# EasyEDA Pro project P3+KG.epro, board PCB2
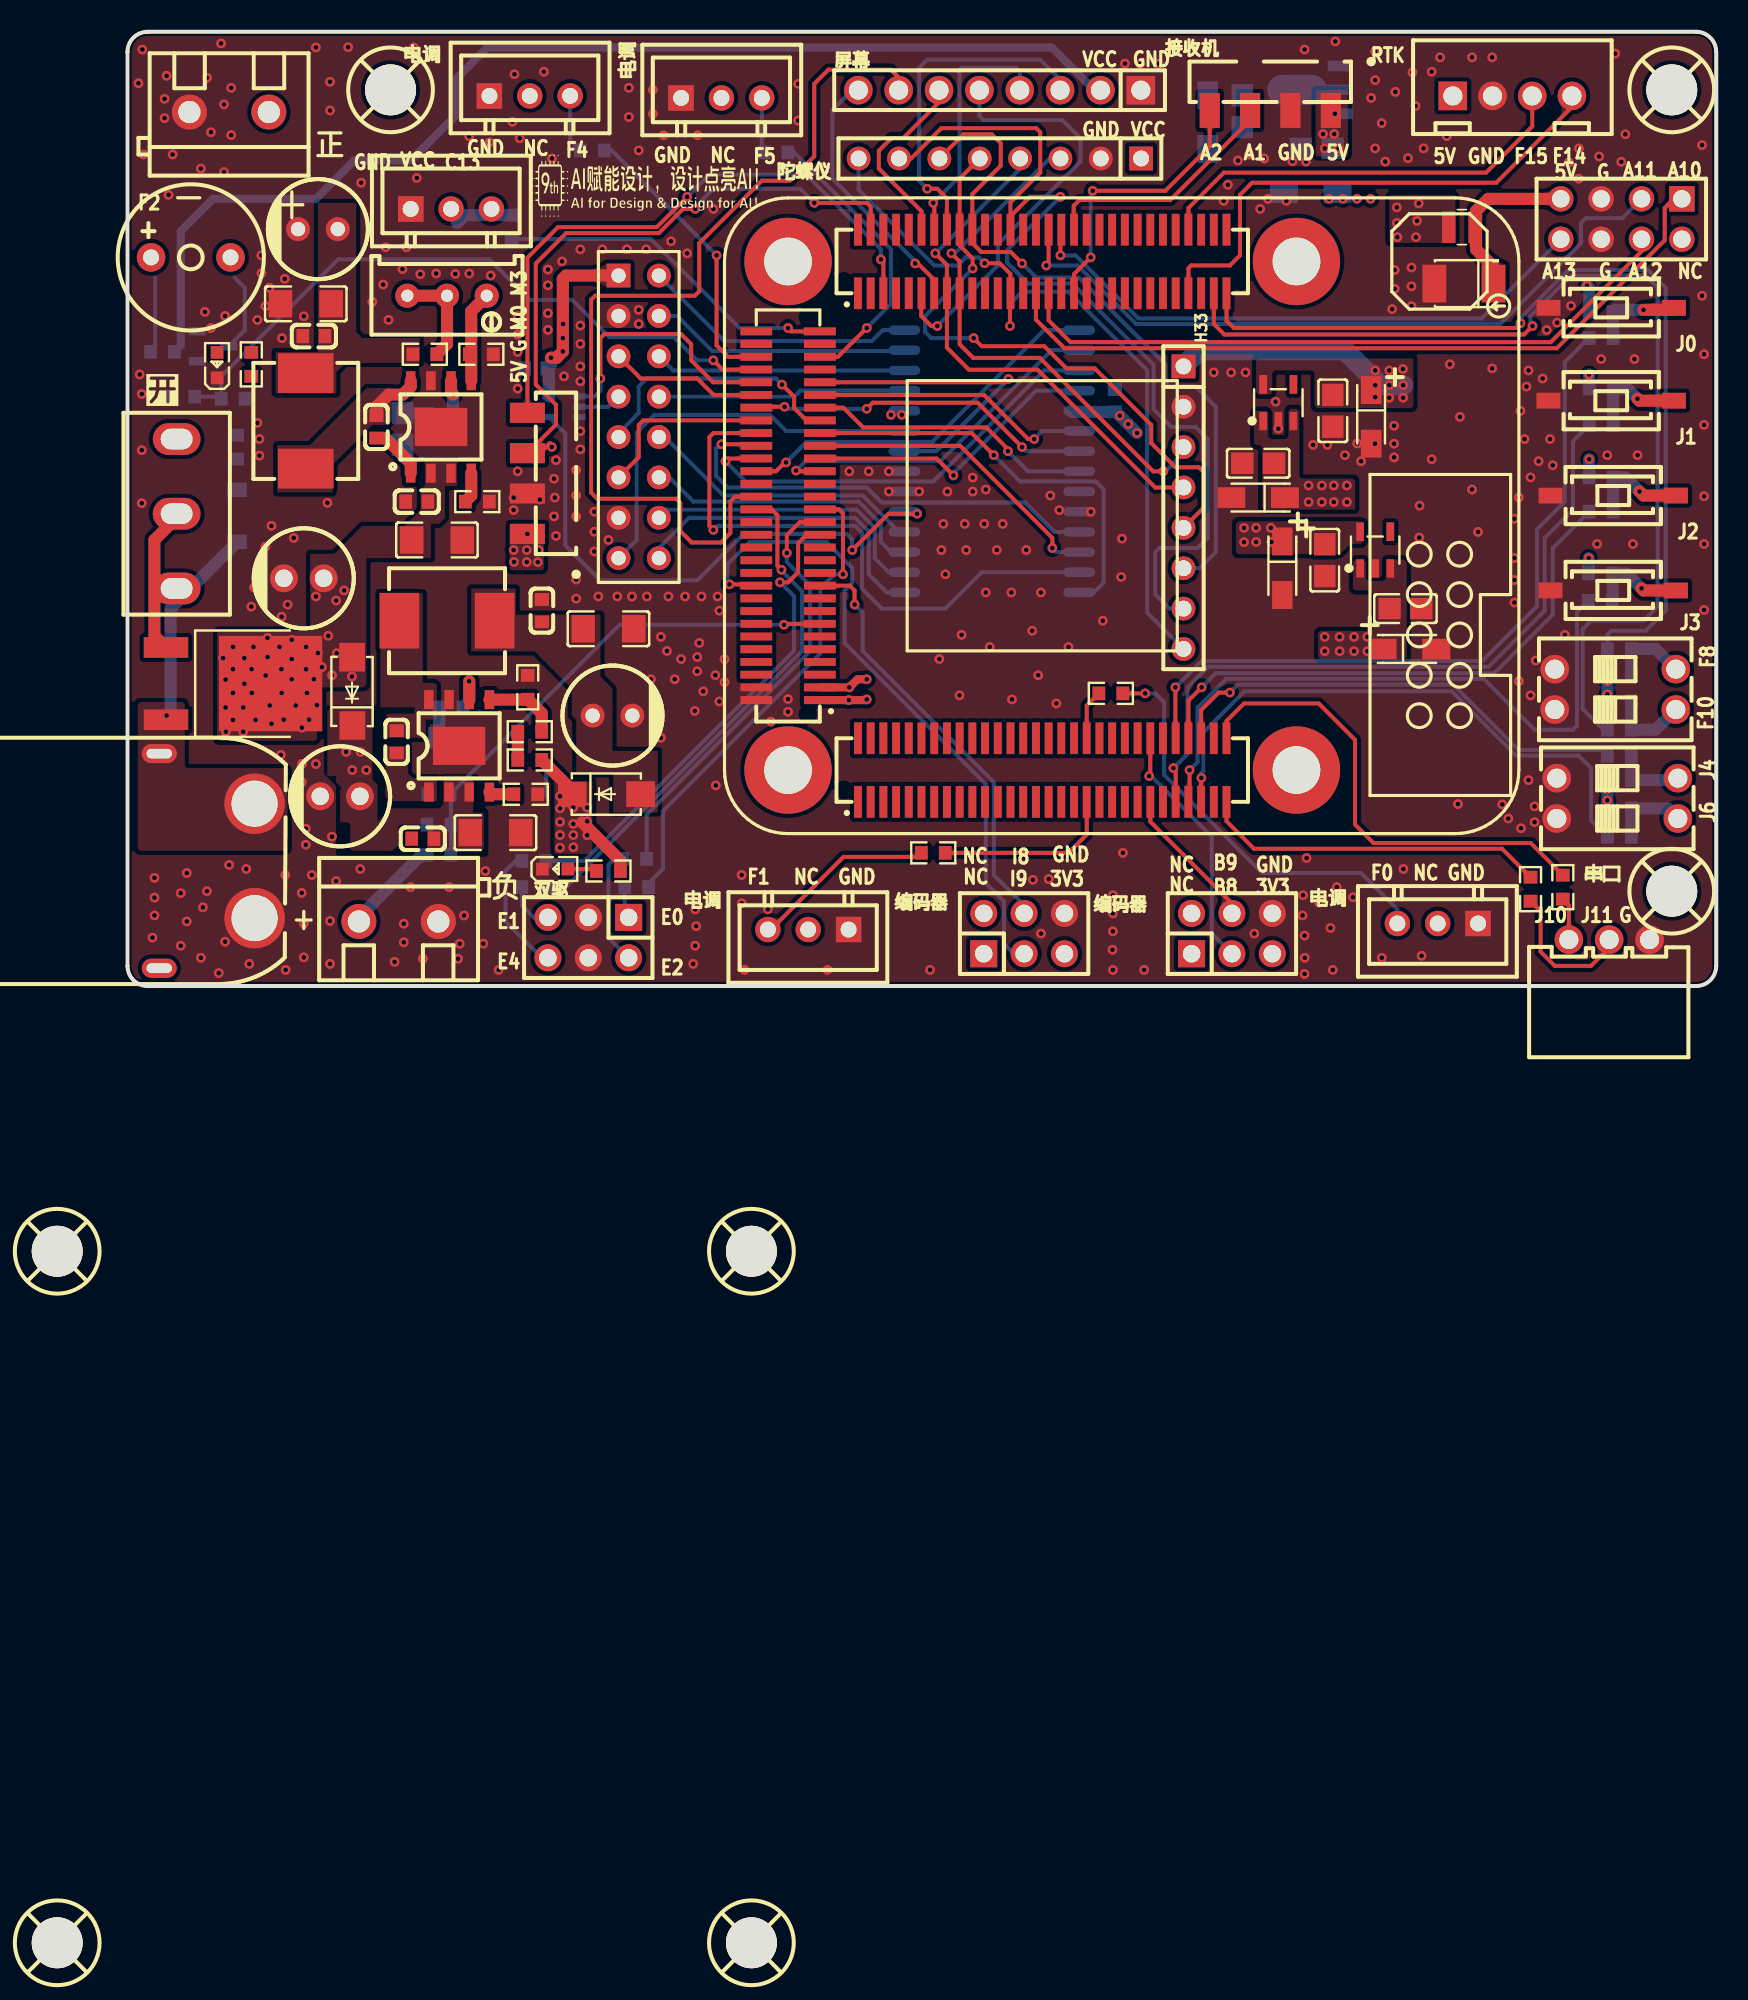
[diagram p9: board, top side]
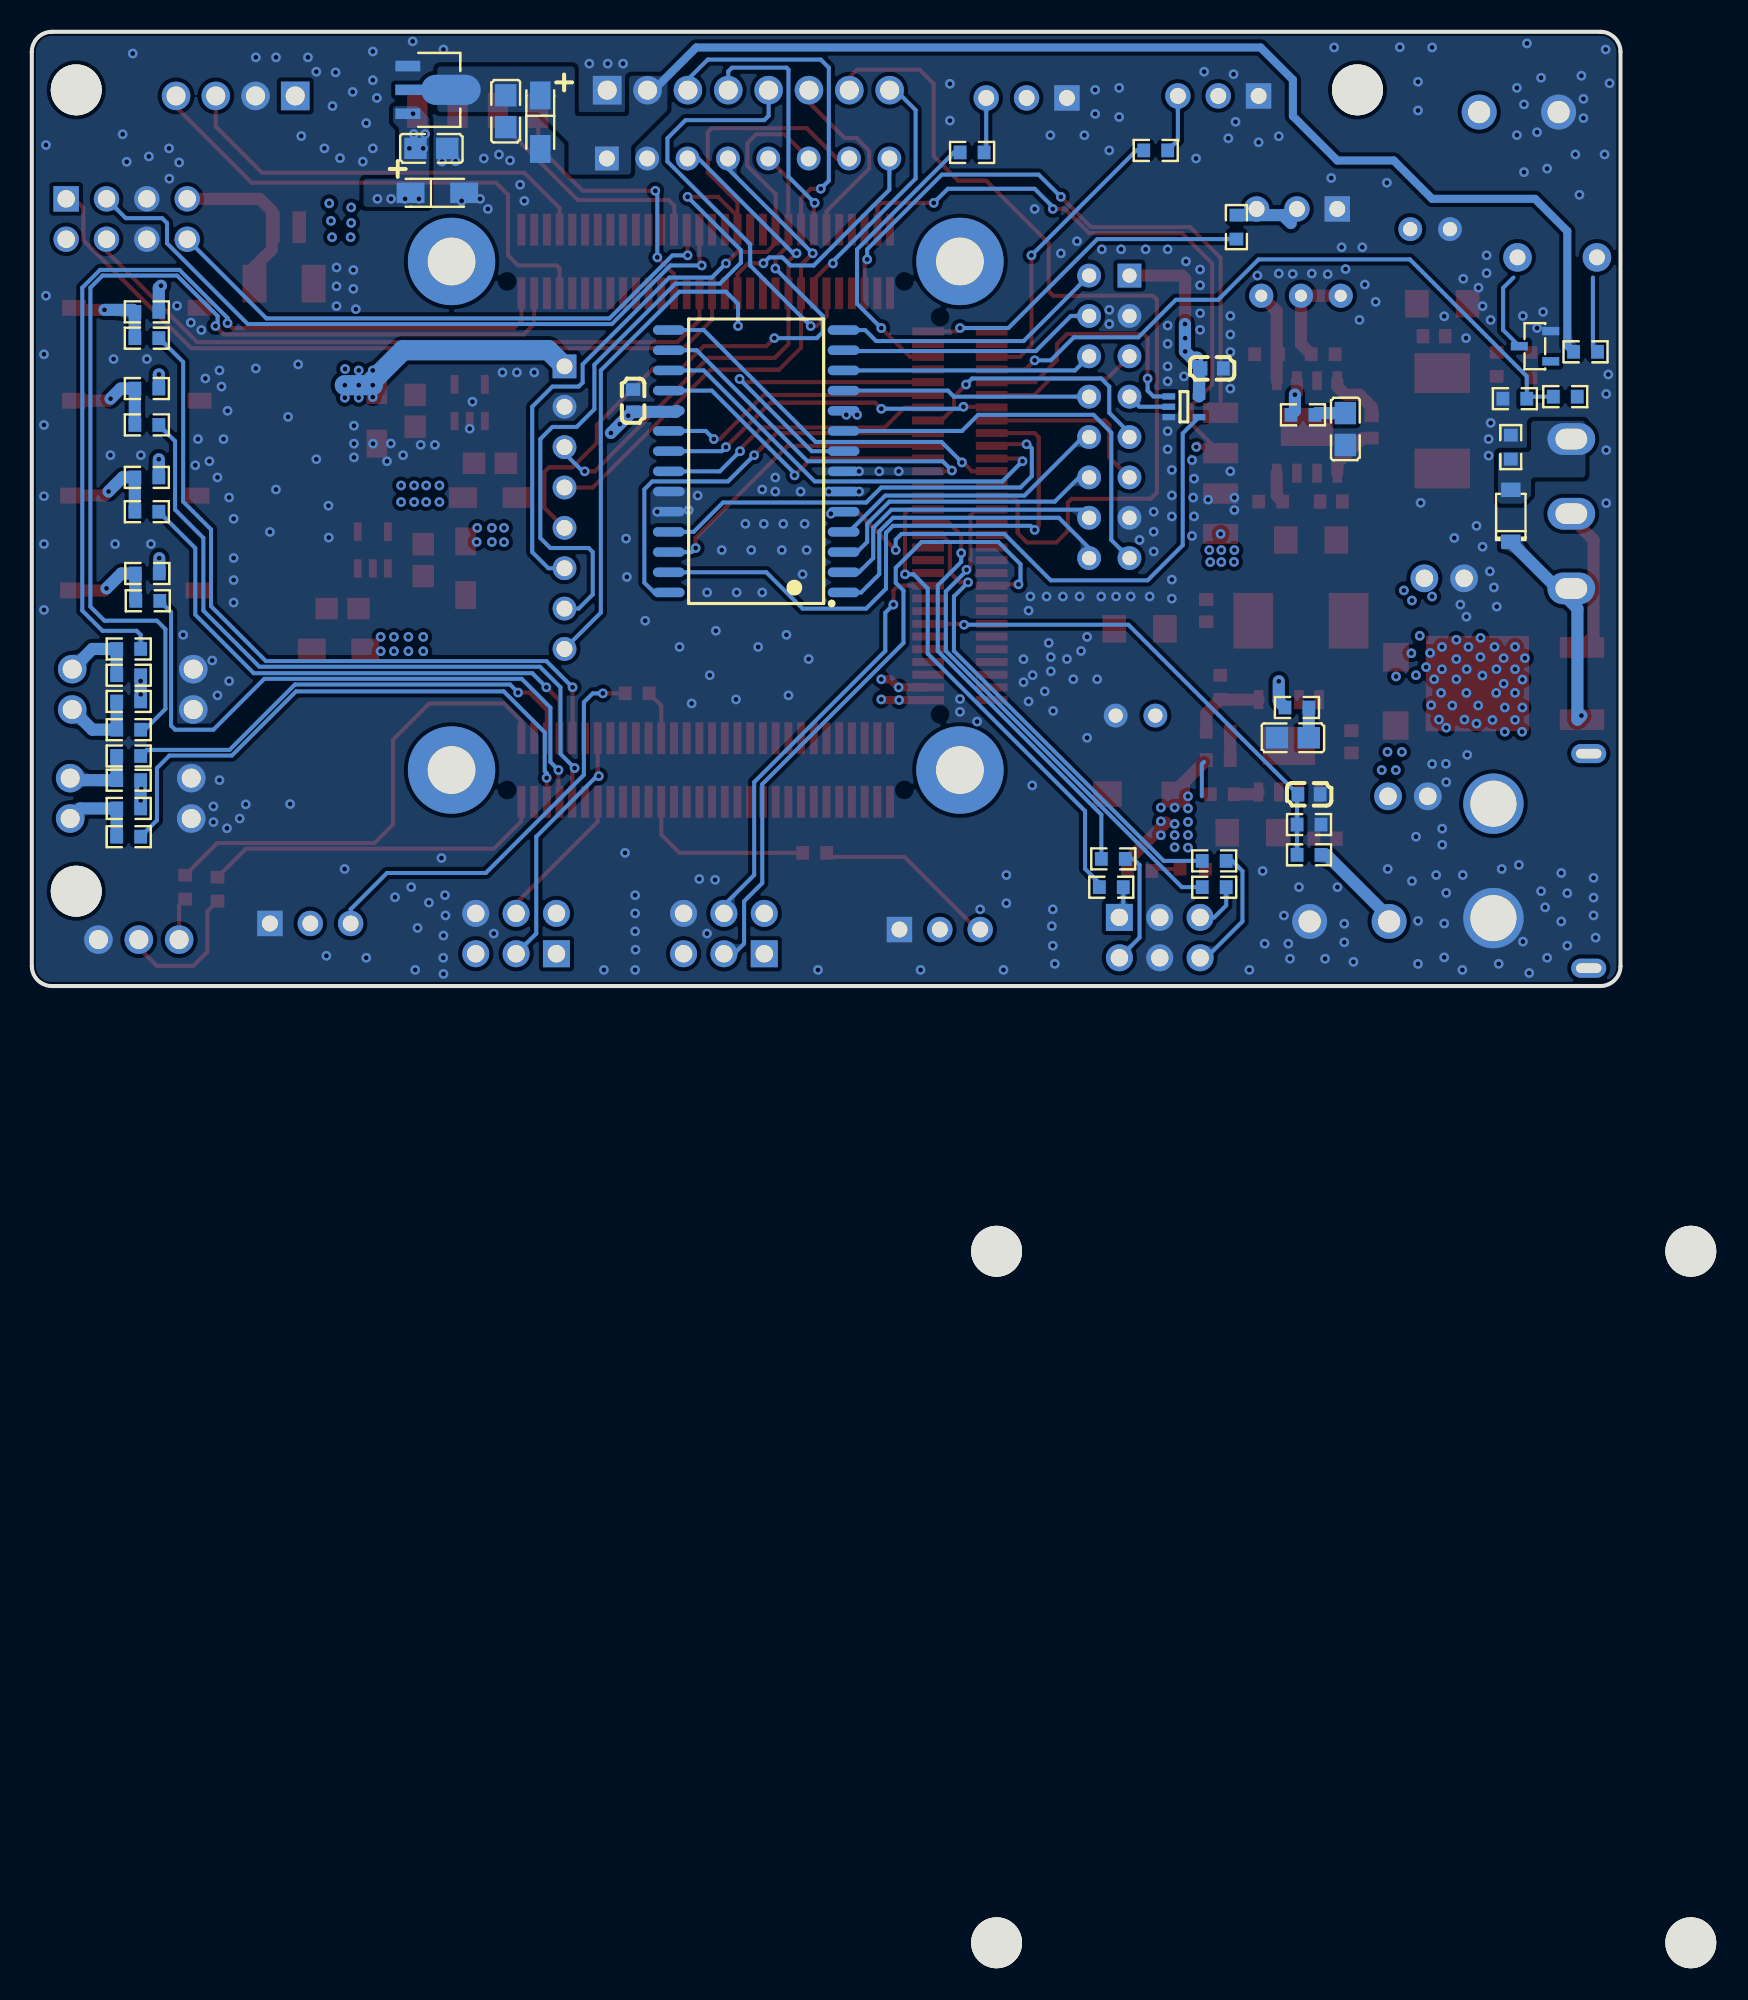
[diagram p10: board, bottom side, seen from below]

Outline 100 x 60.04 mm; copper layers: Top Layer, GND, VCC, Bottom Layer. Coordinates in mm from the lower left corner of the outline.
Outline path: 0,58.77 0,1.27 arc(0.37,0.37) 1.27,0 98.73,0 arc(99.63,0.37) 100,1.27 100,58.77 arc(99.63,59.67) 98.73,60.04 1.27,60.04 arc(0.37,59.67) 0,58.77
Stack: Top Layer 0.035mm 外层铜厚1oz / Dielectric1 0.2104mm 7628 RC49% 8.6mil / GND 0.0152mm 内层铜厚 / Dielectric2 1.065mm 1.1mm H/HOZ Copper / VCC 0.0152mm 内层铜厚 / Dielectric3 0.2104mm 7628 RC49% 8.6mil / Bottom Layer 0.035mm 外层铜厚1oz

## Design rules (mm)
template: 自定义配置
spacing copperThickness1oz (default): track to track 0.102, other pairs 0.152 to 0.3
spacing copperThickness2oz: track to track 0.203, other pairs 0.152 to 0.3
track width copperThickness1oz (default): min 0.127, default 0.254, max 2.54
track width copperThickness2oz: min 0.203, default 0.254, max 2.54
differential pair differentialPair (default): width min 0.127, default 0.254, max 2.54; gap min 0.152, default 0.152
via viaSize (default): diameter min 0.5, default 0.61, max 10; hole min 0.3, default 0.305, max 6.3

## Placement (name value [footprint] x y rotation side)
1  RT9013-33GB  [SOT-23-5_L3.0-W1.7-P0.95-LS2.8-BL]  78.53 27.43 0 top
BUZZER2  3kHz  [BUZ-TH_BD9.0-P5.00-D0.6-FD]  3.98 45.85 0 top
C1  100uF  [CAP-TH_BD6.3-P2.50-D0.6-FD]  11.1 25.65 180 top
C2  4.7uF  [C1206]  19.48 28.07 180 top
C3  100nF  [C0603]  18.21 30.48 0 top
C4  100nF  [C0603]  15.67 35.18 90 top
C5  47uF  [C1206]  11.22 42.93 0 top
C6  220uF  [CAP-TH_BD6.3-P2.50-D0.5-FD]  11.99 47.62 180 top
C7  100nF  [C0603]  11.73 40.89 0 top
C8  4.7nF  [C0805]  17.32 35.05 270 bottom
C9  100uF  [CAP-TH_BD6.3-P2.50-D0.6-FD]  13.38 11.94 180 top
C10  4.7uF  [C1206]  23.16 9.65 180 top
C11  100nF  [C0603]  18.59 9.27 0 top
C12  100nF  [C0603]  16.94 15.37 90 top
C13  47uF  [C1206]  30.27 22.48 180 top
C14  220uF  [CAP-TH_BD6.3-P2.50-D0.5-FD]  30.53 17.02 0 top
C15  100nF  [C0603]  26.08 23.62 270 top
C16  4.7nF  [C0805]  20.62 15.62 0 bottom
C18  10uF  [CAP-SMD_L3.2-W1.6-RD-C7171]  67.99 54.36 270 bottom
C19  100nF  [C0805]  70.17 55.04 90 bottom
C20  100nF  [C0805]  74.85 52.7 0 bottom
C21  10uF  [CAP-SMD_L3.2-W1.6-RD-C7171]  74.47 49.91 180 bottom
C42  10uF  [CAP-SMD_L3.2-W1.6-RD-C7171]  71.17 30.73 180 top
C43  100nF  [C0805]  71.17 32.89 0 top
C44  100nF  [C0805]  75.87 36.19 90 top
C45  10uF  [CAP-SMD_L3.2-W1.6-RD-C7171]  78.28 35.81 270 top
C80  10uF  [CAP-SMD_L3.2-W1.6-RD-C7171]  72.69 26.29 270 top
C81  10uF  [CAP-SMD_L3.2-W1.6-RD-C7171]  80.69 21.21 0 top
C82  100nF  [C0805]  80.44 23.75 180 top
C83  100nF  [C0805]  75.36 26.8 90 top
C85  100nF  [C0603]  19.61 12.06 0 bottom
C258  47uF  [CASE-B_3528]  84.12 44.2 180 top
C259  100nF  [C0603]  25.7 38.86 0 bottom
C260  100nF  [C0603]  62.15 36.83 270 bottom
CN1  ZX-XH2.54-3PZZ  [CONN-TH_3P-P2.54_2501S-3P]  42.85 3.56 180 top
CN2  ZX-XH2.54-3PZZ  [CONN-TH_3P-P2.54_2501S-3P]  82.47 3.94 180 top
CN3  ZX-XH2.54-3PZZ  [CONN-TH_3P-P2.54_2501S-3P]  25.32 56.01 0 top
CN4  ZX-XH2.54-3PZZ  [CONN-TH_3P-P2.54_2501S-3P]  37.39 55.88 0 top
CN5  ZX-XH2.54-3PZZ  [CONN-TH_3P-P2.54_2501S-3P]  20.37 48.89 0 top
CN6  AXH-4A-11  [CONN-TH_KH-XH-4A-Z]  87.17 56.01 0 top
CN7  XT60PW-M  [CONN-TH_XT60PW-M]  5 7.87 0 top
CN9  XH-3AW  [CONN-TH_3P-P2.54_HCTL_XH-3AW]  93.27 2.92 180 top
D6  BZT52C16  [SOD-123_L2.7-W1.6-LS3.7-RD]  6.91 29.59 90 bottom
D7  SS54  [SMA_L4.3-W2.6-LS5.0-FD]  14.14 18.54 270 top
D8  SS54  [SMA_L4.3-W2.6-LS5.0-FD]  30.15 12.06 180 top
H27  PZ254V-11-08P  [HDR-TH_8P-P2.54-V-M]  54.91 52.07 180 top
H29  PZ254V-12-6P  [HDR-TH_6P-P2.54-V-M-R2-C3-S2.54]  29 3.05 180 top
H30  PM254V-12-08-H85  [HDR-TH_8P-P2.54-V-F-R2-C4-S2.54]  94.03 48.26 180 top
H31  PZ254V-12-6P  [HDR-TH_6P-P2.54-V-M-R2-C3-S2.54]  69.52 3.3 0 top
H32  PZ254V-12-6P  [HDR-TH_6P-P2.54-V-M-R2-C3-S2.54]  56.44 3.3 0 top
H33  PZ254V-11-08P  [HDR-TH_8P-P2.54-V-M]  66.47 30.1 270 top
L1  4.7uH  [IND-SMD_L7.3-W6.6_YSPI07XX]  11.22 35.56 90 top
L2  4.7uH  [IND-SMD_L7.3-W6.6_YSPI07XX]  20.11 22.99 0 top
LED1  -  [LED_0603]  5.64 39.12 90 top
LED2  -  [LED_0603]  26.97 7.37 0 top
P16  Camera Interface  [Cam_HDR2X8]  30.91 44.7 270 top
Q1  HY19P03D  [TO-252-2_L6.6-W6.1-P4.57-LS9.9-TL-CW]  5.72 19.03 0 top
Q2  S8050  [SOT-23-3_L2.9-W1.3-P1.90-LS2.3-BR]  5.38 40.26 180 bottom
Q13  AMS1117-3.3V  [SOT-89-3_L4.5-W2.5-P1.50-LS4.2-BR]  74.98 56.39 0 bottom
R1  200kΩ  [R0603]  22.02 30.48 180 top
R2  20kΩ  [R0603]  19.99 35.94 180 bottom
R3  27kΩ  [R0603]  18.72 39.75 180 top
R4  50kΩ  [RES-ADJ-TH_3P-L9.5-W4.85-P2.50-BL-BS]  20.11 43.43 270 top
R5  8.2kΩ  [R0603]  22.27 39.75 180 top
R6  10kΩ  [R0603]  7.79 39.12 270 top
R7  200kΩ  [R0603]  25.07 12.06 180 top
R8  20kΩ  [R0603]  20.37 17.53 180 bottom
R12  10kΩ  [R0603]  30.27 7.24 0 top
R13  51kΩ  [R0603]  25.32 14.22 0 top
R14  1.5kΩ  [R0603]  25.32 16 180 top
R15  10kΩ  [R0603]  25.19 18.8 270 top
R20  100Ω  [R0603]  25.57 6.22 180 bottom
R21  100Ω  [R0603]  32.05 6.22 0 bottom
R22  100Ω  [R0603]  25.57 7.87 180 bottom
R23  100Ω  [R0603]  31.92 8 0 bottom
R24  100Ω  [R0603]  50.72 8.38 0 top
R25  100Ω  [R0603]  61.9 18.41 180 top
R26  100Ω  [R0603]  29.26 52.58 0 bottom
R27  100Ω  [R0603]  40.81 52.45 0 bottom
R28  100Ω  [R0603]  93.9 14.48 180 bottom
R29  100Ω  [R0603]  93.9 9.4 180 bottom
R30  100Ω  [R0603]  92.76 40.77 180 bottom
R31  100Ω  [R0603]  92.76 35.31 180 bottom
R32  100Ω  [R0603]  92.76 29.84 180 bottom
R33  100Ω  [R0603]  92.7 24.24 180 bottom
R34  4.7kΩ  [R0603]  93.9 12.95 0 bottom
R35  4.7kΩ  [R0603]  93.9 11.18 0 bottom
R36  4.7kΩ  [R0603]  92.76 42.42 0 bottom
R37  4.7kΩ  [R0603]  92.76 37.59 0 bottom
R38  4.7kΩ  [R0603]  92.76 32 0 bottom
R39  4.7kΩ  [R0603]  92.73 25.96 0 bottom
R40  10kΩ  [R0603]  19.61 8.25 0 bottom
R41  1kΩ  [R0603]  19.61 10.16 180 bottom
R42  10kΩ  [R0603]  6.91 33.91 270 bottom
R43  100Ω  [R0603]  24.18 47.75 90 bottom
R44  10Ω  [R0603]  2.2 39.91 180 bottom
R45  4.7kΩ  [R0603]  3.48 37.08 180 bottom
R46  10kΩ  [R0603]  6.65 36.96 0 bottom
R47  100Ω  [R0603]  93.9 21.21 180 bottom
R48  100Ω  [R0603]  93.9 16.13 180 bottom
R49  4.7kΩ  [R0603]  93.9 19.56 0 bottom
R50  4.7kΩ  [R0603]  93.9 17.91 0 bottom
R51  100Ω  [R0603]  90.34 6.22 90 top
R52  100Ω  [R0603]  88.31 6.1 90 top
SCREW1  -  [M3螺丝]  16.56 56.39 0 top
SCREW2  -  [M3螺丝]  97.2 5.97 0 top
SCREW3  -  [M3螺丝]  97.2 56.39 0 top
SCREW4  -  [M3螺丝]  -4.42 -60.2 0 top
SCREW5  -  [M3螺丝]  39.27 -60.2 0 top
SCREW6  -  [M3螺丝]  39.27 -16.69 0 top
SCREW7  -  [M3螺丝]  -4.42 -16.69 0 top
SW1  K2-1107ST-A1SW-06  [SW-SMD_L6.0-W3.6-LS8.0]  93.39 42.67 180 top
SW3  K2-1107ST-A1SW-06  [SW-SMD_L6.0-W3.6-LS8.0]  93.52 30.86 180 top
SW4  K2-1107ST-A1SW-06  [SW-SMD_L6.0-W3.6-LS8.0]  93.52 24.89 180 top
SW5  K2-1107ST-A1SW-06  [SW-SMD_L6.0-W3.6-LS8.0]  93.39 36.83 180 top
SW6  DSWB02LHGET  [SW-TH_DSWB02LHGET]  93.77 11.81 270 top
SW9  SS-12D10L5  [SW-TH_SS-12D10L5]  3.1 29.72 90 top
SW10  DSWB02LHGET  [SW-TH_DSWB02LHGET]  93.65 18.67 270 top
U1  -  [SR6P3C4_CoreBoard_Lite]  57.58 29.59 90 top
U2  SCT2450STER  [ESOP-8_L4.9-W3.9-P1.27-LS6.0-BL-EP]  19.73 35.18 0 top
U3  SCT2450STER  [ESOP-8_L4.9-W3.9-P1.27-LS6.0-BL-EP]  20.88 15.11 0 top
U10  RT9013-33GB  [SOT-23-5_L3.0-W1.7-P0.95-LS2.8-BL]  72.44 36.7 0 top
U20  -  [HDR-TH_8P-P2.54-V-F-1]  56.56 58.04 180 top
U21  SN74LVC1G00DCKR  [SOT-353]  27.48 36.45 180 bottom
U22  AL422B  [SOP-28]  54.4 33.02 0 bottom
U23  KF301-5.0-2P  [CONN-TH_P5.00_KF301-5.0-2P]  17.07 4.06 0 top
U25  KF301-5.0-2P  [CONN-TH_P5.00_KF301-5.0-2P]  6.4 54.99 180 top
U26  4.7uH  [IND-SMD_L2.5-W2.0-VLS252012CX-150M]  83.99 47.75 0 top
U29  DZ254S-11-04-48  [HDR-SMD_4P-P2.54-V-M-LS4.8_R2]  71.93 56.9 180 top
U30  DZ254S-11-04-48  [HDR-SMD_4P-P2.54-V-M-LS4.8_R2]  26.97 32.26 90 top

## Footprints (pads in the part's own frame, mm; a bottom-side part is the same pattern mirrored in y, then rotated)
BUZ-TH_BD9.0-P5.00-D0.6-FD
  round 1.8 hole 1: 1(-2.5,0) 2(2.5,0)
C0603
  rect 0.8x0.9 smd: 1(-0.7,0) 2(0.7,0)
C0805
  rect 1.41x1.35 smd: 1(-1,0) 2(1,0)
C1206
  rect 1.485x1.728 smd: 1(-1.593,0) 2(1.593,0)
Cam_HDR2X8
  rect 1.5x1.5 hole 0.9: 1(0,0)
  round 1.5 hole 0.9: 2(0,2.54) 3(2.54,0) 4(2.54,2.54) 5(5.08,0) 6(5.08,2.54) 7(7.62,0) 8(7.62,2.54) 9(10.16,0) 10(10.16,2.54) 11(12.7,0) 12(12.7,2.54) 13(15.24,0) 14(15.24,2.54) 15(17.78,0) 16(17.78,2.54)
CAP-SMD_L3.2-W1.6-RD-C7171
  rect 1.758x1.296 smd: 1(-1.687,0) 2(1.687,0)
CAP-TH_BD6.3-P2.50-D0.5-FD
  round 1.5 hole 0.9: 1(-1.25,0) 2(1.25,0)
CAP-TH_BD6.3-P2.50-D0.6-FD
  round 1.75 hole 1.1: 1(-1.25,0) 2(1.25,0)
CASE-B_3528
  rect 1.506x2.376 smd: 1(-1.861,0) 2(1.861,0)
CONN-TH_3P-P2.54_2501S-3P
  rect 1.6x1.6 hole 1: 1(-2.54,0)
  round 1.6 hole 1: 2(0,0) 3(2.54,0)
CONN-TH_3P-P2.54_HCTL_XH-3AW
  round 1.8 hole 1.199: 1(-2.54,0) 2(0.002,0) 3(2.54,0)
CONN-TH_KH-XH-4A-Z
  rect 1.8x1.8 hole 1.2: 1(-3.75,0)
  round 1.8 hole 1.2: 2(-1.25,0) 3(1.25,0) 4(3.75,0)
CONN-TH_P5.00_KF301-5.0-2P
  round 2.2 hole 1.4: 1(-2.5,0) 2(2.5,0)
CONN-TH_XT60PW-M
  round 3.8 hole 2.9: 1(3,-3.6) 2(3,3.6)
  oval 2.2x1.2 hole 1.6x0.6: 3(-3,6.75) 4(-3,-6.75)
ESOP-8_L4.9-W3.9-P1.27-LS6.0-BL-EP
  rect 0.6x1.2 smd: 1(-1.905,-2.909) 2(-0.635,-2.909) 3(0.635,-2.909) 4(1.905,-2.909) 5(1.905,2.909) 6(0.635,2.909) 7(-0.635,2.909) 8(-1.905,2.909)
  rect 3.3x2.4 smd: 9(0,0)
HDR-SMD_4P-P2.54-V-M-LS4.8_R2
  rect 1.27x2.2 smd: 1(-3.81,1.8) 2(-1.27,1.8) 3(1.27,1.8) 4(3.81,1.8)
HDR-TH_6P-P2.54-V-M-R2-C3-S2.54
  rect 1.7x1.7 hole 1.1: 1(-2.54,-1.27)
  round 1.7 hole 1.1: 2(-2.54,1.27) 3(0,-1.27) 4(0,1.27) 5(2.54,-1.27) 6(2.54,1.27)
HDR-TH_8P-P2.54-V-F-1
  rect 1.8x1.8 hole 1.2: 1(-7.22,1.67)
  round 1.8 hole 1.2: 2(-4.68,1.67) 3(-2.14,1.67) 4(0.4,1.67) 5(2.94,1.67) 6(5.48,1.67) 7(8.02,1.67) 8(10.56,1.67)
HDR-TH_8P-P2.54-V-F-R2-C4-S2.54
  rect 1.6x1.6 hole 1.1: 1(-3.81,-1.27)
  round 1.6 hole 1.1: 2(-3.81,1.27) 3(-1.27,-1.27) 4(-1.27,1.27) 5(1.27,-1.27) 6(1.27,1.27) 7(3.81,-1.27) 8(3.81,1.27)
HDR-TH_8P-P2.54-V-M
  rect 1.5x1.5 hole 1: 1(-8.89,0)
  round 1.5 hole 1: 2(-6.35,0) 3(-3.81,0) 4(-1.27,0) 5(1.27,0) 6(3.81,0) 7(6.35,0) 8(8.89,0)
IND-SMD_L2.5-W2.0-VLS252012CX-150M
  rect 0.85x2 smd: 1(-0.83,0) 2(0.83,0)
IND-SMD_L7.3-W6.6_YSPI07XX
  rect 2.5x3.5 smd: 1(-3,0) 2(3,0)
LED_0603
  rect 0.8x0.8 smd: 1(-0.851,-0.01) 2(0.75,-0.005)
M3螺丝
  round 3.2 hole 3.2: 1(0,0)
R0603
  rect 0.806x0.864 smd: 1(-0.753,0) 2(0.753,0)
RES-ADJ-TH_3P-L9.5-W4.85-P2.50-BL-BS
  round 1.524 hole 0.762: 1(0,2.5) 2(0,0) 3(0,-2.5)
SMA_L4.3-W2.6-LS5.0-FD
  rect 1.8x1.62 smd: 1(-2.15,-0.009) 2(2.15,0.009)
SOD-123_L2.7-W1.6-LS3.7-RD
  rect 0.91x1.22 smd: 1(-1.635,0) 2(1.635,0)
SOP-28
  oval 2x0.6 smd: 1(-5.5,8.255) 2(-5.5,6.985) 3(-5.5,5.715) 4(-5.5,4.445) 5(-5.5,3.175) 6(-5.5,1.905) 7(-5.5,0.635) 8(-5.5,-0.635) 9(-5.5,-1.905) 10(-5.5,-3.175) 11(-5.5,-4.445) 12(-5.5,-5.715) 13(-5.5,-6.985) 14(-5.5,-8.255) 15(5.5,-8.255) 16(5.5,-6.985) 17(5.5,-5.715) 18(5.5,-4.445) 19(5.5,-3.175) 20(5.5,-1.905) 21(5.5,-0.635) 22(5.5,0.635) 23(5.5,1.905) 24(5.5,3.175) 25(5.5,4.445) 26(5.5,5.715) 27(5.5,6.985) 28(5.5,8.255)
SOT-23-3_L2.9-W1.3-P1.90-LS2.3-BR
  rect 1.07x0.532 smd: 1(0.99,-0.95) 2(0.99,0.95) 3(-0.99,0)
SOT-23-5_L3.0-W1.7-P0.95-LS2.8-BL
  rect 0.49x1.157 smd: 1(-0.95,-1.153) 2(0,-1.153) 3(0.95,-1.153)
  rect 0.49x1.175 smd: 4(0.95,1.153) 5(-0.95,1.153)
SOT-89-3_L4.5-W2.5-P1.50-LS4.2-BR
  rect 1.575x0.672 smd: 1(1.356,-1.5) 3(1.356,1.5)
  custom 5.377x1.9 smd: 2(-1.356,0)
SOT-353
  rect 0.8x0.4 smd: 1(-0.95,0.65) 2(-0.95,0) 3(-0.95,-0.65) 4(0.95,-0.65) 5(0.95,0.65)
SR6P3C4_CoreBoard_Lite
  round 5.5 hole 3: 0(-16,16) 0(-16,-16) 0(16,16) 0(16,-16)
  round 0 hole 0.65: 1(-17.25,12.5) 1(-17.25,-12.5) 1(-12.5,14.75) 1(12.5,14.75) 1(14.75,12.5) 1(14.75,-12.5)
  rect 0.5x2 smd: A1(-11.6,14) A2(-11.6,18) A3(-10.8,14) A4(-10.8,18) A5(-10,14) A6(-10,18) A7(-9.2,14) A8(-9.2,18) A9(-8.4,14) A10(-8.4,18) A11(-7.6,14) A12(-7.6,18) A13(-6.8,14) A14(-6.8,18) A15(-6,14) A16(-6,18) A17(-5.2,14) A18(-5.2,18) A19(-4.4,14) A20(-4.4,18) A21(-3.6,14) A22(-3.6,18) A23(-2.8,14) A24(-2.8,18) A25(-2,14) A26(-2,18) A27(-1.2,14) A28(-1.2,18) A29(-0.4,14) A30(-0.4,18) A31(0.4,14) A32(0.4,18) A33(1.2,14) A34(1.2,18) A35(2,14) A36(2,18) A37(2.8,14) A38(2.8,18) A39(3.6,14) A40(3.6,18) A41(4.4,14) A42(4.4,18) A43(5.2,14) A44(5.2,18) A45(6,14) A46(6,18) A47(6.8,14) A48(6.8,18) A49(7.6,14) A50(7.6,18) A51(8.4,14) A52(8.4,18) A53(9.2,14) A54(9.2,18) A55(10,14) A56(10,18) A57(10.8,14) A58(10.8,18) A59(11.6,14) A60(11.6,18)
  rect 2x0.5 smd: B1(-18,11.6) B2(-14,11.6) B3(-18,10.8) B4(-14,10.8) B5(-18,10) B6(-14,10) B7(-18,9.2) B8(-14,9.2) B9(-18,8.4) B10(-14,8.4) B11(-18,7.6) B12(-14,7.6) B13(-18,6.8) B14(-14,6.8) B15(-18,6) B16(-14,6) B17(-18,5.2) B18(-14,5.2) B19(-18,4.4) B20(-14,4.4) B21(-18,3.6) B22(-14,3.6) B23(-18,2.8) B24(-14,2.8) B25(-18,2) B26(-14,2) B27(-18,1.2) B28(-14,1.2) B29(-18,0.4) B30(-14,0.4) B31(-18,-0.4) B32(-14,-0.4) B33(-18,-1.2) B34(-14,-1.2) B35(-18,-2) B36(-14,-2) B37(-18,-2.8) B38(-14,-2.8) B39(-18,-3.6) B40(-14,-3.6) B41(-18,-4.4) B42(-14,-4.4) B43(-18,-5.2) B44(-14,-5.2) B45(-18,-6) B46(-14,-6) B47(-18,-6.8) B48(-14,-6.8) B49(-18,-7.6) B50(-14,-7.6) B51(-18,-8.4) B52(-14,-8.4) B53(-18,-9.2) B54(-14,-9.2) B55(-18,-10) B56(-14,-10) B57(-18,-10.8) B58(-14,-10.8) B59(-18,-11.6) B60(-14,-11.6) C1(14,11.6) C2(18,11.6) C3(14,10.8) C4(18,10.8) C5(14,10) C6(18,10) C7(14,9.2) C8(18,9.2) C9(14,8.4) C10(18,8.4) C11(14,7.6) C12(18,7.6) C13(14,6.8) C14(18,6.8) C15(14,6) C16(18,6) C17(14,5.2) C18(18,5.2) C19(14,4.4) C20(18,4.4) C21(14,3.6) C22(18,3.6) C23(14,2.8) C24(18,2.8) C25(14,2) C26(18,2) C27(14,1.2) C28(18,1.2) C29(14,0.4) C30(18,0.4) C31(14,-0.4) C32(18,-0.4) C33(14,-1.2) C34(18,-1.2) C35(14,-2) C36(18,-2) C37(14,-2.8) C38(18,-2.8) C39(14,-3.6) C40(18,-3.6) C41(14,-4.4) C42(18,-4.4) C43(14,-5.2) C44(18,-5.2) C45(14,-6) C46(18,-6) C47(14,-6.8) C48(18,-6.8) C49(14,-7.6) C50(18,-7.6) C51(14,-8.4) C52(18,-8.4) C53(14,-9.2) C54(18,-9.2) C55(14,-10) C56(18,-10) C57(14,-10.8) C58(18,-10.8) C59(14,-11.6) C60(18,-11.6)
SW-SMD_L6.0-W3.6-LS8.0
  rect 1.5x1 smd: 1(-3.95,0) 2(3.95,0)
SW-TH_DSWB02LHGET
  round 1.8 hole 1.2: 1(-1.27,3.81) 2(1.27,3.81) 3(-1.27,-3.81) 4(1.27,-3.81)
SW-TH_SS-12D10L5
  oval 2x3 hole 1.3x2: 1(-4.7,0) 2(0,0) 3(4.7,0)
TO-252-2_L6.6-W6.1-P4.57-LS9.9-TL-CW
  rect 2.8x1.3 smd: 1(-3.292,2.273) 3(-3.292,-2.273)
  rect 6.5x6 smd: 2(3.292,0)

## Nets
As in the schematic.

Pads without a net: 1 4; CN1 2; CN2 2; CN3 2; CN4 2; CN7 4; H30 2; H31 1 2; H32 1 2; SCREW1 1; SCREW2 1; SCREW3 1; SCREW4 1; SCREW5 1; SCREW6 1; SCREW7 1; U1 0 1 A5 A6 A7 A8 A9 A10 A11 A12 A14 A21 A22 A23 A24 A25 A26 A28 A30 A33 A35 A36 B1 B2 B3 B4 B5 B6 B7 B8 B9 B10 B11 B12 B13 B14 B15 B16 B17 B18 B19 B20 B21 B22 B23 B24 B25 B26 B27 B28 B39 B40 B41 B42 B43 B44 B45 B46 B49 B50 C1 C2 C3 C6 C7 C8 C19 C21 C22 C23 C24 C27 C28 C39 C40 C41 C42 C43 C44 C45 C46 C47 C48 C49 C50 C51 C52 C55 C56; U10 4

## Via types
v1: diameter 0.61, hole 0.305, Top Layer to Bottom Layer, 574 vias

## Routing (per net, layer and track width the routed paths; a pad name or vN(x,y) marks a point on that pad's centre or on a via; arc(x,y) is an arc through that point)
GND:
  vias: v1(0.69,56.8) v1(0.77,38.48) v1(0.9,37.25) v1(0.9,33.72) v1(0.9,30.38) v1(0.94,58.93) v1(1,52.32) v1(1.57,3.05) v1(1.7,6.81) v1(1.7,5.56) v1(1.7,4.44) v1(2.33,55.82) v1(2.33,54.61) v1(2.46,57.28) v1(2.59,49.78) v1(2.84,52.32) v1(3.35,5.84) v1(3.35,2.54) v1(3.73,7.11) v1(3.73,4.06) v1(4.62,51.43) v1(4.62,1.78) v1(4.75,4.95) v1(4.87,42.42) v1(5,57.15) v1(5,5.97) v1(5.25,53.72) v1(5.25,41.4) v1(5.75,0.82) v1(5.89,59.31) v1(6.07,55.47) v1(6.07,51.21) v1(6.14,42.16) v1(6.14,2.79) v1(6.4,7.62) v1(6.52,56.51) v1(6.52,53.54) v1(7.48,7.37) v1(7.67,1.4) v1(7.79,23.88) v1(7.97,25.08) v1(8.18,41.91) v1(8.18,35.43) v1(8.22,26.09) v1(8.3,34.42) v1(8.3,33.37) v1(8.43,45.97) v1(8.43,44.85) v1(8.68,42.78) v1(8.68,27.64) v1(8.94,43.94) v1(9.06,28.96) v1(9.7,23.24) v1(9.65,14.55) v1(9.72,40.77) v1(9.9,44.5) v1(9.93,6.98) v1(9.95,1.02) v1(10.08,24) v1(10.46,28.19) v1(10.99,13.98) v1(10.97,12.83) v1(10.97,5.86) v1(11.1,42.14) v1(11.1,3.94) v1(11.1,1.8) v1(11.22,9.91) v1(11.22,8.89) v1(11.6,6.98) v1(11.86,59.05) v1(11.86,13.97) v1(12.58,30.41) v1(12.75,56.9) v1(12.75,55.09) v1(12.75,4.1) v1(12.75,1.4) v1(12.87,9.4) v1(13.13,6.6) v1(13.89,59.07) v1(14.71,50.55) v1(14.65,7.37) v1(15.41,43.05) v1(16.1,44.14) v1(16.25,46.48) v1(16.43,41.91) v1(16.81,1.52) v1(17.31,45.11) v1(17.39,3.92) v1(17.39,2.75) v1(17.56,46.48) v1(17.82,6.22) v1(18.02,59.05) v1(18.21,50.84) v1(18.43,44.79) v1(18.6,1.72) v1(19.43,44.83) v1(20.24,6.22) v1(20.64,44.81) v1(20.81,1.72) v1(20.91,2.67) v1(21.19,4.44) v1(21.51,53.47) v1(21.51,44.83) v1(22.4,2.67) v1(22.53,7.24) v1(22.78,53.09) v1(22.86,44.7) v1(23.36,1.02) v1(24.23,54.38) v1(24.3,30.73) v1(24.3,29.95) v1(24.36,57.37) v1(24.56,42.16) v1(24.56,40.99) v1(24.56,39.89) v1(24.56,37.59) v1(24.56,32.39) v1(24.69,53.34) v1(25.96,30.61) v1(26.21,57.53) v1(26.46,45.08) v1(26.46,44.09) v1(26.46,42.33) v1(26.46,41.29) v1(26.72,52.07) v1(26.84,31.93) v1(26.9,30.73) v1(26.84,29.55) v1(26.97,33.09) v1(26.97,28.32) v1(27.35,45.59) v1(27.48,38.36) v1(28.24,32.47) v1(28.24,30.87) v1(28.24,29.55) v1(28.24,25.58) v1(28.24,24.38) v1(28.51,46.35) v1(28.51,41.56) v1(28.51,40.41) v1(28.51,38.99) v1(28.51,38.05) v1(28.51,34.91) v1(28.51,33.77) v1(29.38,29.84) v1(29.38,28.59) v1(29.38,27.34) v1(29.64,24.51) v1(29.89,46.35) v1(30.27,28.07) v1(30.83,24.51) v1(31.44,46.35) v1(31.56,56.51) v1(31.56,54.68) v1(31.75,24.51) v1(32.18,52.58) v1(32.18,42.54) v1(32.18,41.66) v1(32.65,46.35) v1(32.69,24.51) v1(32.94,19.3) v1(33.07,56.39) v1(33.07,54.87) v1(33.58,21.97) v1(33.58,15.62) v1(33.74,53.53) v1(33.96,21.08) v1(34.05,24.51) v1(34.21,46.86) v1(34.44,19.3) v1(34.84,20.57) v1(35.1,24.51) v1(35.23,46.1) v1(35.61,1.4) v1(35.71,17.31) v1(35.73,4.83) v1(35.8,3.77) v1(35.73,2.54) v1(35.89,53.53) v1(35.86,20.7) v1(35.86,19.8) v1(35.99,21.59) v1(36.13,24.51) v1(36.24,18.54) v1(36.88,48.89) v1(37,19.56) v1(37.03,12.62) v1(37.14,24.51) v1(37.26,23.62) v1(37.26,17.91) v1(37.58,20.56) v1(37.58,19.11) v1(38.66,6.98) v1(38.66,5.21) v1(38.84,1.02) v1(40.31,4.83) v1(40.5,16.64) v1(41.58,18.06) v1(41.58,17.25) v1(42.21,56.77) v1(42.21,54.46) v1(44.06,1.02) v1(45.43,32.38) v1(46.66,32.38) v1(47.93,32.38) v1(47.93,31.11) v1(49.83,31.11) v1(50.51,1.02) v1(51.1,20.57) v1(51.23,27.43) v1(51.36,29.08) v1(51.48,25.91) v1(51.61,31.11) v1(52.37,18.29) v1(52.5,22.1) v1(52.7,29.08) v1(52.79,27.43) v1(53.2,32) v1(53.2,31.11) v1(54.02,31.24) v1(53.92,29.08) v1(54.02,24.76) v1(54.28,21.34) v1(54.71,27.43) v1(55.09,29.08) v1(55.63,24.76) v1(55.67,18.03) v1(56.57,27.43) v1(56.94,22.35) v1(56.99,6.68) v1(57.32,19.56) v1(57.49,24.76) v1(57.5,3.3) v1(57.99,6.73) v1(58.09,30.86) v1(58.47,17.78) v1(58.65,29.94) v1(59.23,21.34) v1(60.63,29.84) v1(61.39,22.99) v1(62.02,5.71) v1(62.02,4.57) v1(62.02,3.44) v1(62,2.29) v1(62.02,1.02) v1(62.6,28.15) v1(62.54,25.74) v1(62.66,8.38) v1(62.78,58.04) v1(63.75,58.04) v1(63.99,1.02) v1(64.91,58.04) v1(68.37,38.61) v1(69,49.4) v1(69.26,50.42) v1(69.47,38.61) v1(69.9,51.94) v1(70.37,38.61) v1(70.6,52.32) v1(70.93,3.3) v1(71.29,48.89) v1(71.55,52.07) v1(71.78,49.53) v1(72.26,36.77) v1(72.44,35.07) v1(72.94,49.4) v1(73.33,51.89) v1(73.99,5.71) v1(73.96,4.44) v1(74.09,58.93) v1(74.09,3.17) v1(74.1,1.78) v1(74.09,0.76) v1(74.18,51.88) v1(74.22,8.06) v1(74.63,34.05) v1(75,5.25) v1(75.52,34.05) v1(75.72,3.66) v1(75.87,1.02) v1(76.03,59.44) v1(76.12,6.22) v1(76.63,33.4) v1(77.14,5.59) v1(77.4,34.14) v1(77.64,33.02) v1(78.28,55.88) v1(78.52,34.13) v1(78.53,58.8) v1(78.53,57) v1(78.53,52.7) v1(78.95,54.29) v1(78.95,1.78) v1(79.17,51.88) v1(79.6,42.59) v1(79.72,35.26) v1(79.72,34.13) v1(79.72,33.26) v1(79.8,56.26) v1(79.76,45.05) v1(79.76,43.87) v1(80.31,7.37) v1(80.6,52.09) v1(80.82,45.21) v1(80.82,44.03) v1(80.82,42.78) v1(80.88,57.49) v1(81.07,55.37) v1(81.31,28.22) v1(81.33,30.23) v1(81.45,1.91) v1(81.58,52.7) v1(82.09,57.53) v1(82.09,33.15) v1(82.62,58.43) v1(83.04,53.48) v1(83.23,39.12) v1(83.74,11.45) v1(83.87,35.81) v1(84.63,58.43) v1(84.63,31.24) v1(85.01,28.57) v1(85.9,58.43) v1(85.9,38.86) v1(86.53,11.43) v1(86.92,10.54) v1(87.3,29.4) v1(87.3,26.93) v1(87.3,25.55) v1(87.3,24.13) v1(87.58,30.74) v1(87.58,19.19) v1(87.68,36.19) v1(87.71,9.93) v1(87.93,34.42) v1(88.06,37.72) v1(88.19,38.73) v1(88.19,12.95) v1(88.31,32) v1(88.31,18.29) v1(88.57,11.3) v1(88.57,10.31) v1(88.64,20.48) v1(88.82,33.02) v1(89.07,38.23) v1(89.33,41.27) v1(89.54,34.42) v1(89.71,32.77) v1(89.99,41.74) v1(90.47,22.1) v1(90.72,51.82) v1(90.86,42.8) v1(91.36,52.7) v1(91.34,50.8) v1(92.5,27.81) v1(92.63,52.2) v1(92.76,39.45) v1(93.14,33.4) v1(93.65,58.67) v1(94.03,51.86) v1(94.28,53.59) v1(94.75,27.81) v1(94.85,39.45) v1(95.05,33.4) v1(99.11,52.91) v1(99.11,43.43) v1(99.23,39.75) v1(99.23,35.3) v1(99.23,30.82) v1(99.23,27.81) v1(99.23,23.67)
VCC: length 13.3
  Bottom Layer w0.762: v1(2.46,17.02) 2.71,16.76 2.71,23.75 6.91,27.94 D6.1
VCC3V3: length 23.5
  Bottom Layer w0.762: R49.1 v1(93.15,19.19) v1(93.15,18.35) R50.1 ; R39.1 v1(91.97,26.92) ; v1(92,38.48) 92,38.47 R37.1 ; R35.1 v1(93.15,11.68) R34.1 ; v1(91.87,44.07) 92,43.93 R36.1 ; R38.1 v1(92,33.15)
  Bottom Layer w1.27: v1(80.3,37.81) v1(79.42,37.81) v1(78.54,37.81) 78.54,38.09 76.63,40 67.48,40 H33.1
  vias: v1(78.54,38.73) v1(78.54,37.05) v1(79.42,38.73) v1(79.42,37.02) v1(80.28,38.82) v1(80.3,37.02) v1(93.11,12.41)
VCC5V: length 13.1
  Top Layer w0.508: v1(46.53,19.3) 45.94,19.3 v1(45.44,18.79) U1.A3 ; v1(46.53,18.03) 46.49,17.99 v1(45.41,17.99) 43.58,17.99
  Top Layer w0.762: R13.2 28,12.3 D8.2 ; 28.62,10.29 31.03,7.88 R12.2
  vias: v1(24.3,27.43) v1(24.33,26.69) v1(25.17,28.45) v1(25.13,27.43) v1(25.13,26.68) v1(25.88,27.43) v1(25.83,26.68) v1(27.23,11.94) v1(27.23,11.18) v1(27.23,10.33) v1(27.23,9.5) v1(27.23,8.71) v1(28.06,11.23) v1(28.06,10.2) v1(28.06,9.5) v1(28.06,8.73) v1(28.93,11.23) v1(28.93,10.36) v1(28.93,9.49) v1(74.34,31.5) v1(74.34,30.45) v1(75.18,31.5) v1(75.18,30.45) v1(75.25,53.61) v1(75.36,52.7) v1(75.36,21.97) v1(75.36,21.07) v1(75.64,49.53) v1(76,54.89) v1(75.96,53.61) v1(75.93,31.5) v1(75.93,30.45) v1(76.23,52.7) v1(76.29,21.97) v1(76.29,21.07) v1(76.5,49.53) v1(76.75,31.5) v1(76.75,30.45) v1(77.2,21.97) v1(77.2,21.07) v1(77.38,49.53) v1(78.04,21.97) v1(78.04,21.07) v1(78.24,49.53) v1(79.9,48.99) v1(79.9,48.02) v1(79.93,47.12) v1(81.1,47.12) v1(81.17,48.14) v1(81.28,49.25)
VCCBAT: length 5.9
  Bottom Layer w0.762: R40.1 18.5,8.25 14.57,4.32
  vias: v1(6.02,20.63) v1(6.17,19.28) v1(6.17,17.53) v1(6.19,16) v1(6.64,21.34) v1(6.64,19.94) v1(6.64,18.44) v1(6.64,16.74) v1(7.29,17.53) v1(7.29,16) v1(7.36,20.63) v1(7.36,19.02) v1(7.81,19.94) v1(7.83,18.44) v1(7.93,21.34) v1(8.06,16.74) v1(8.69,19.54) v1(8.81,21.91) v1(8.82,20.7) v1(8.96,17.65) v1(9.06,16.51) v1(9.57,21.34) v1(9.69,19.94) v1(9.7,18.44) v1(9.83,16.76) v1(10.33,21.79) v1(10.33,20.57) v1(10.33,19.3) v1(10.59,17.65) v1(10.97,16.26) v1(11.24,21.34) v1(11.24,19.94) v1(11.3,18.44) v1(11.43,16.76) v1(11.73,19.3) v1(11.86,24.51) v1(11.92,17.67) v1(11.99,20.95) v1(12.24,20.07) v1(12.64,22.04) v1(12.87,19.56) v1(13.13,24.26) v1(13.17,20.94) v1(13.64,24.89) v1(14.13,19.48)
VCCCAM: length 19
  Top Layer w0.762: P16.1 27.61,44.7 27.4,44.5 v1(27.4,40.77) v1(27.4,39.93) 27.01,39.53 v1(26.66,39.53)
  Bottom Layer w0.762: 59.4,36.19 59.46,36.13 C260.2 62.22,36.13 v1(62.46,35.89) v1(62.99,35.36) v1(63.55,34.8) ; v1(27.42,41.66) 27.42,39.94 v1(27.4,39.93) 27.01,39.53 v1(26.66,39.53) 26.66,39.12 C259.2 26.53,38.73 U21.5
  vias: v1(48.05,35.94) v1(48.73,35.94) v1(70.28,28.83) v1(70.28,27.93) v1(71.04,28.83) v1(71.04,27.94) v1(71.97,28.83) v1(72,27.94)
VCCTFT: length 73
  Bottom Layer w0.508: 61.24,55.99 58.18,59.05 22.65,59.05 20.62,57.02 20.62,54.74 17.83,51.94 14.27,51.94 11.86,49.53 5.38,49.53 3.35,47.5 3.35,40.3 R44.1
A1: length 15.5
  Top Layer w0.254: U1.C36 59.56,47.61 59.56,49.1 59.92,49.45 65.63,49.45 70.66,54.48 U29.3
A2: length 17.7
  Top Layer w0.254: v1(60.75,50.04) 65.33,50.04 68.12,52.83 U29.4 ; U1.C35 59.58,44.8 v1(60.63,45.85)
  Bottom Layer w0.254: v1(60.63,45.85) 60.63,49.91 v1(60.75,50.04)
A10: length 48.1
  Top Layer w0.254: U1.C29 57.18,41.93 58.97,40.13 89.97,40.13 96.76,46.92 96.76,48.96 97.33,49.53 H30.1
A11: length 45.3
  Top Layer w0.254: v1(57.83,45.34) 57.98,45.48 U1.C32
  Bottom Layer w0.254: v1(57.83,45.34) 59.8,45.34 63.49,41.65 86.4,41.65 91.49,46.73 91.49,48.01 91.79,48.31 94.08,48.31 H30.3
A12: length 42.7
  Top Layer w0.254: H30.4 95.3,46.23 89.58,40.51 59.36,40.51 57.98,41.89 U1.C31
A13: length 36.8
  Top Layer w0.254: v1(58.72,45.97) 58.72,47.53 U1.C34
  Bottom Layer w0.254: v1(58.72,45.97) 59.67,45.97 63.64,42.01 85.23,42.01 H30.8
B8: length 15.8
  Top Layer w0.254: v1(64.31,13.21) 64.38,13.28 U1.B48
  Bottom Layer w0.254: H31.3 68.25,3.3 68.25,9.4 64.44,13.21 v1(64.31,13.21)
B9: length 9.1
  Top Layer w0.254: U1.B47 64.38,10.34 69.52,5.21 H31.4
C0: length 23.5
  Top Layer w0.254: v1(41.45,32.94) 41.37,32.94 40.82,32.39 U1.A38
  Bottom Layer w0.254: v1(41.45,32.94) 42.74,34.23 50.66,34.23 57.7,41.27 59.4,41.27
C1: length 22
  Top Layer w0.254: v1(42.08,32.44) 42.16,32.44 42.21,32.39 U1.A37
  Bottom Layer w0.254: v1(42.08,32.44) 42.67,33.02 51.17,33.02 58.15,40 59.4,40
C2: length 27.2
  Top Layer w0.254: U1.A40 37.81,33.19 v1(37.64,33.02)
  Bottom Layer w0.254: 59.4,38.73 57.71,38.73 50.72,31.75 38.91,31.75 v1(37.64,33.02)
C3: length 18.5
  Top Layer w0.254: U1.A39 50.93,33.19 v1(51.99,32.13)
  Bottom Layer w0.254: v1(51.99,32.13) 51.99,32.26 57.2,37.46 59.4,37.46
C4: length 28.2
  Top Layer w0.254: 39.58,33.99 39.48,34.09 v1(37.39,34.09)
  Bottom Layer w0.254: 59.4,28.57 58.34,28.57 56.49,30.42 47.47,30.42 46.53,31.37 37.77,31.37 37.06,32.08 37.06,33.83 37.31,34.09 v1(37.39,34.09)
C5: length 19
  Top Layer w0.254: v1(58.21,27.56) 58.21,28.19 52.42,33.99 43.58,33.99
  Bottom Layer w0.254: 59.4,27.3 58.47,27.3 v1(58.21,27.56)
C6: length 36.8
  Top Layer w0.254: U1.A44 36.88,34.79 36.62,34.54 36.62,28.96 v1(36.88,28.7)
  Bottom Layer w0.254: 59.4,26.03 53.77,26.03 51.48,23.75 47.48,23.75 46.23,25 46.23,28.52 45.8,28.96 37.13,28.96 v1(36.88,28.7)
C7: length 27.5
  Top Layer w0.254: U1.A43 53.14,34.79 v1(54.53,33.4)
  Bottom Layer w0.254: v1(54.53,33.4) 56.18,31.75 60.94,31.75 61.44,31.25 61.44,25.38 60.83,24.76 59.4,24.76
C8: length 11.3
  Top Layer w0.254: U1.A46 32.46,35.59 32.18,35.31 32.18,33.27 P16.11
C9: length 16.8
  Top Layer w0.254: U1.A45 42.73,35.59 41.96,36.37 41.96,37.08 v1(41.19,37.85)
  Bottom Layer w0.254: P16.9 30.91,34.8 32.18,36.07 32.18,37.72 32.69,38.23 40.81,38.23 v1(41.19,37.85)
C13: length 21.8
  Top Layer w0.254: U1.A59 41.79,41.19 v1(41.58,41.4)
  Bottom Layer w0.254: v1(41.58,41.4) 38.53,41.4 32.93,47 R43.1
D0-MOSI: length 33
  Top Layer w0.254: v1(50.85,46.1) 51.58,45.37 U1.C15 51.58,40.16 52.96,38.78 57.28,38.78 64.69,31.37 H33.4
  Bottom Layer w0.254: v1(50.85,46.1) 56.18,51.43 H27.4
D1-MISO: length 38.9
  Top Layer w0.254: 53.64,52.07 52.38,50.81 U1.C18 52.38,46.6 53.2,45.78 v1(53.2,45.15) ; v1(53.26,40.77) 53.77,40.26 57.71,40.26 59.1,38.86 60.88,38.86 64.44,35.31 64.44,34.16 65.96,32.64 67.44,32.64 67.74,32.35 67.74,30.1 H33.5
  Bottom Layer w0.254: v1(53.2,45.15) 50.21,42.16 50.21,41.15 50.59,40.77 v1(53.26,40.77)
D2-SCK: length 33.5
  Top Layer w0.254: v1(65.2,32.38) 64.56,32.38 57.42,39.52 53.23,39.52 52.38,40.38 U1.C17 52.38,45.59 v1(51.86,46.1)
  Bottom Layer w0.254: v1(51.86,46.1) 52.07,46.1 58.04,52.07 H27.3 ; H33.3 66.47,33.53 65.33,32.38 v1(65.2,32.38)
D3-CS: length 43.6
  Top Layer w0.254: v1(56.31,45.47) 55.59,46.19 53.74,46.19 53.18,46.75 U1.C20 53.18,49.83 54.96,51.61 54.96,53.03 54.4,53.59 52.62,53.59 H27.6
  Bottom Layer w0.254: v1(56.31,45.47) 57.2,44.58 59.86,44.58 65.33,39.12 65.33,37.97 65.58,37.72 67.23,37.72 68.5,36.45 68.5,27.3 67.48,26.29 H33.6
D14: length 21.3
  Top Layer w0.254: v1(46.53,36.32) 46.91,36.7 53.51,36.7 v1(56.31,33.91) ; U1.A48 39.64,36.45 v1(41.36,36.45)
  Bottom Layer w0.254: v1(46.53,36.32) 41.49,36.32 v1(41.36,36.45) ; 59.4,33.65 56.56,33.65 v1(56.31,33.91)
D15: length 17.6
  Top Layer w0.254: v1(55.42,33.65) 55.42,33.78 54.05,35.15 46.31,35.15 45.06,36.39 U1.A47
  Bottom Layer w0.254: 59.4,32.38 56.69,32.38 v1(55.42,33.65)
E0: length 30.6
  Top Layer w0.254: 43.58,29.99 44.78,29.99 45.03,29.74 v1(45.03,25.91)
  Bottom Layer w0.254: v1(45.03,25.91) 44.5,25.91 43.61,25.02 43.61,20.92 33.7,11.01 33.7,7.37 32.55,6.22
E1: length 33
  Top Layer w0.254: 39.58,29.99 40.54,29.99 40.91,29.62 40.91,26.45 v1(41.16,26.19)
  Bottom Layer w0.254: v1(41.16,26.19) 41.16,26.13 42.47,24.83 42.47,21.08 27.61,6.22 R20.1
E2: length 27.7
  Top Layer w0.254: v1(41.5,27.25) 41.5,28.37 42.32,29.19 U1.A29
  Bottom Layer w0.254: R23.2 32.68,10.79 42.97,21.08 42.97,25.21 41.5,26.68 v1(41.5,27.25)
E4: length 30.7
  Top Layer w0.254: v1(41.07,25.4) 41.58,25.4 42.21,26.03 42.21,27.87 42.84,28.5 43.47,28.5 U1.A27
  Bottom Layer w0.254: R22.1 28.75,7.87 41.96,21.08 41.96,24.51 v1(41.07,25.4)
F0: length 3.1
  Top Layer w0.254: U1.B38 60.38,17.65 R25.2
F1: length 11.4
  Top Layer w0.254: U1.B37 60.38,9.53 59.23,8.38 R24.2
F2: length 42.7
  Top Layer w0.254: U1.A54 37.46,38.79 v1(36.88,39.37)
  Bottom Layer w0.254: v1(36.88,39.37) 35.86,39.37 34.41,40.82 30.35,40.82 27.99,43.18 25.32,43.18 22.78,45.72 13.26,45.72 5.9,38.36 R46.1 5.77,37.08 R45.1
F4: length 18.3
  Top Layer w0.254: U1.A56 37.8,39.59 37.08,40.31 v1(37.08,45.97)
  Bottom Layer w0.254: v1(37.08,45.97) 30.47,52.58 R26.2
F5: length 18.3
  Top Layer w0.254: U1.A55 44.72,39.59 v1(46.53,41.4)
  Bottom Layer w0.254: v1(46.53,41.4) 48.05,42.93 48.05,46.35 41.96,52.45 R27.2
F8: length 57.2
  Top Layer w0.254: U1.C59 69.18,41.87 69.64,41.4 87.37,41.4 v1(87.68,41.71)
  Bottom Layer w0.254: v1(87.68,41.71) 87.68,42.03 90.7,45.06 95.7,45.06 96.82,43.94 96.82,23.62 95.55,22.35 93.4,22.35 93.15,22.1 R47.2
F10: length 65.3
  Top Layer w0.254: v1(88.44,41.53) 87.91,40.99 69.04,40.99 68.38,41.66 U1.C57
  Bottom Layer w0.254: v1(88.44,41.53) 88.36,41.45 88.3,41.45 88.3,42.15 90.85,44.7 95.55,44.7 96.31,43.94 96.31,23.88 95.42,22.99 92.12,22.99 91.59,22.45 91.59,17.43 93.02,16 R48.2
F14: length 32.8
  Top Layer w0.254: CN6.4 90.92,55.31 86.15,50.55 70.79,50.55 70.02,49.78 70.02,45.97 69.39,45.34 66.96,45.34 66.78,45.16 U1.C53
F15: length 27.1
  Top Layer w0.254: U1.C54 66.78,48.95 69.01,51.18 85.52,51.18 88.42,54.08 CN6.3
H9: length 59.4
  Top Layer w0.254: H27.7 49.32,52.07 51.23,53.97 57.2,53.97 57.45,53.72 57.45,51.18 55.58,49.31 55.58,48.44 ; v1(58.72,49.66) 56.8,49.66 55.58,48.44 ; U1.C26 55.58,48.44
  Bottom Layer w0.254: v1(58.72,49.66) 55.37,46.3 55.37,45.51 56.68,44.2 59.48,44.2 64.59,39.09 64.59,36.29 65.7,35.18 67.23,35.18 67.99,34.42 67.99,28.19 67.36,27.56 64.94,27.56 64.69,27.3 64.69,24.64 65.58,23.75 H33.7
H10: length 48.3
  Top Layer w0.254: v1(53.95,45.48) 54.9,45.48 55.58,44.8 U1.C25 55.55,43.56 v1(55.55,41.53)
  Bottom Layer w0.254: H33.8 64.18,23.49 64.18,38.74 59.23,43.69 56.31,43.69 55.55,42.93 v1(55.55,41.53) ; 53.95,45.48 53.58,45.85 52.75,45.85 52.24,45.34 50.78,45.34 46.02,50.1 46.02,52.07
H12: length 9.7
  Top Layer w0.254: U1.A50 36.9,37.19 35.86,38.23 32.31,38.23 P16.5
H13: length 17.2
  Top Layer w0.254: v1(57.07,34.42) 56.69,34.42 53.92,37.19 U1.A49
  Bottom Layer w0.254: 59.4,34.92 57.58,34.92 v1(57.07,34.42)
H14: length 16.6
  Top Layer w0.254: v1(29.77,38.23) 29.77,40.77 30.02,41.02 34.84,41.02 35.48,40.39 35.48,39.37 36.86,37.99 39.58,37.99
  Bottom Layer w0.254: U21.1 29.4,37.1 29.77,37.46 v1(29.77,38.23)
H15: length 20.9
  Top Layer w0.254: v1(55.45,38.2) 55.25,37.99 43.58,37.99
  Bottom Layer w0.254: 48.4,33.65 50.91,33.65 v1(55.45,38.2)
HREF: length 2.7
  Bottom Layer w0.254: U21.2 30.27,36.45 P16.7
I8: length 27.1
  Top Layer w0.254: U1.A19 45.47,25.19 45.77,24.89 v1(45.77,24)
  Bottom Layer w0.254: v1(45.77,24) 46.28,23.49 46.28,21.08 54.53,12.83 54.53,6.98 56.44,5.08 H32.4
I9: length 41.7
  Top Layer w0.254: v1(37.89,25.27) 39.5,25.27 U1.A20
  Bottom Layer w0.254: H32.3 55.8,2.03 55.17,2.67 55.17,5.33 54.02,6.48 54.02,12.7 45.13,21.59 45.13,24.89 45.62,25.37 45.62,26.31 43.99,27.94 39.16,27.94 37.77,26.54 37.77,25.4 v1(37.89,25.27)
J0: length 46.3
  Top Layer w0.254: v1(65.96,18.8) 65.96,16.64 65.98,16.62 U1.B52
  Bottom Layer w0.254: R30.2 91.98,40.77 90.47,39.26 90.47,30.48 88.72,28.73 88.72,23.9 85.26,20.45 67.61,20.45 v1(65.96,18.8)
J1: length 45
  Top Layer w0.254: U1.B51 65.98,13.57 v1(65.83,13.72)
  Bottom Layer w0.254: v1(65.83,13.72) 66.72,14.6 66.72,18.8 68.02,20.09 85.67,20.09 89.2,23.62 89.2,28.19 90.98,29.97 90.98,34.28 R31.2
J2: length 35
  Top Layer w0.254: v1(67.61,18.8) 66.78,17.96 U1.B54
  Bottom Layer w0.254: R32.2 89.71,27.55 89.71,23.37 86.03,19.68 68.5,19.68 v1(67.61,18.8)
J3: length 40.9
  Top Layer w0.254: 66.85,11.09 v1(66.85,13.59)
  Bottom Layer w0.254: v1(66.85,13.59) 67.36,14.1 67.36,17.53 69.16,19.33 85.37,19.33 88.57,16.13 90.98,16.13 91.23,16.38 91.23,23.53 R33.2
J4: length 29.9
  Top Layer w0.254: v1(69.39,18.47) 68.68,18.47 67.58,17.37 U1.B56
  Bottom Layer w0.254: v1(69.39,18.47) 69.9,18.97 83.44,18.97 87.55,14.86 92.77,14.86 R28.2
J6: length 36.6
  Top Layer w0.254: U1.B55 67.58,13.08 v1(67.59,13.1)
  Bottom Layer w0.254: R29.2 92.12,10.42 92.12,13.72 91.34,14.5 87.4,14.5 83.36,18.54 70.29,18.54 67.71,15.96 67.71,13.53 67.59,13.41 v1(67.59,13.1)
J10: length 30.3
  Top Layer w0.254: R51.2 88.33,9 78.43,9 77.26,10.16 77.26,15.49 74.98,17.78 70.28,17.78 69.18,16.68 U1.B60
J11: length 21.8
  Top Layer w0.254: U1.B59 69.18,10.37 70.91,8.64 86.52,8.64 R52.2
K4: length 31.5
  Top Layer w0.254: v1(41.32,22.73) 41.38,22.79 U1.A13
  Bottom Layer w0.254: R40.2 R41.1 20.36,12.01 C85.2 30.97,22.73 v1(41.32,22.73)
K14: length 16.3
  Top Layer w0.254: U1.C13 50.78,44.44 49.75,45.47 v1(49.58,45.47)
  Bottom Layer w0.254: 46,55.99 45.24,55.99 44.37,55.12 44.37,50.8 49.58,45.59 v1(49.58,45.47)
K15-SCK: length 21.9
  Top Layer w0.254: U1.C16 51.58,49.56 50.97,50.16 v1(50.34,50.16)
  Bottom Layer w0.254: v1(50.34,50.16) 49.83,50.67 49.83,57.78 50.34,58.29 57.45,58.29 58.7,57.04 58.7,55.99
L7: length 58.4
  Top Layer w0.254: U1.A34 38.26,30.79 37.95,30.48 37.95,28.5 37.35,27.91 35.51,27.91 34.79,28.63 34.79,30.41 34.54,30.66 29.57,30.66 29.18,31.05 29.18,43.18 29.44,43.43 35.71,43.43 35.99,43.71 35.99,46.74 39.93,50.67 41.69,50.67 43.23,52.21 43.23,56.77 44.12,57.66 48.05,57.66 48.54,57.17 48.54,55.99
M0: length 40.2
  Top Layer w0.254: v1(43.23,49.28) 46.53,49.28 46.78,49.03 U1.C4 ; v1(26.71,33.92) 26.59,34.04 26.59,34.16 25.96,33.53 U30.3 26.97,35.33 26.97,36.58 25.7,37.85 25.7,45.47 27.61,47.37 33.44,47.37 34.97,48.89 v1(35.73,48.89)
  Bottom Layer w0.254: v1(35.73,48.89) 35.73,49.02 36.88,50.16 42.34,50.16 v1(43.23,49.28)
M3: length 38.9
  Top Layer w0.254: U30.4 25.17,45.82 27.1,47.75 33.32,47.75 v1(35.23,49.66) ; v1(47.42,45.72) 47.58,45.56 U1.C5
  Bottom Layer w0.254: v1(47.42,45.72) 47.42,46.35 42.72,51.05 36.62,51.05 v1(35.23,49.66)
M8: length 11.5
  Top Layer w0.254: 51.08,55.99 51.08,55.61 48.83,53.36 48.09,53.36 47.29,52.56 47.29,51.43 49.98,48.75 U1.C12
M9-RST: length 26.4
  Top Layer w0.254: v1(50.97,41.53) 50.59,41.53 49.96,42.16 49.96,43.57 U1.C11
  Bottom Layer w0.254: v1(50.97,41.53) 54.78,45.34 54.78,46.68 59.99,51.88 59.99,53.34 58.85,54.48 53.9,54.48 53.62,54.76 53.62,55.99
M10-MOSI: length 16.3
  Top Layer w0.254: v1(50.72,49.28) 50.78,49.22 U1.C14
  Bottom Layer w0.254: 56.16,55.99 56.16,57.55 55.93,57.78 52.5,57.78 52.37,57.66 52.37,50.93 v1(50.72,49.28)
PCLK: length 25.6
  Bottom Layer w0.254: P16.15 32.05,28.07 32.05,34.82 33.17,35.94 40.43,35.94 41.45,34.92 48.4,34.92
WE: length 34.5
  Top Layer w0.254: v1(49.7,29.72) 47.91,29.72 v1(45.62,27.43)
  Bottom Layer w0.254: v1(45.62,27.43) 45.62,28.09 45.26,28.45 38.78,28.45 35.86,25.53 29.77,25.53 27.56,27.74 27.56,34.77 U21.4
$1N1463: length 1.9
  Top Layer w0.762: R1.2 21.64,30.85 U2.4
$1N1588: length 3.4
  Top Layer w0.762: C4.1 16.24,34.48 17.83,32.89 U2.1
$1N1593: length 3.6
  Top Layer w0.762: C4.2 15.67,36.45 16.43,37.21 17.32,37.21 17.83,37.72 U2.8
$1N1988: length 2.3
  Top Layer w0.762: 20.37,38.09 20.37,37.34 v1(20.49,37.21)
  Bottom Layer w0.762: v1(20.49,37.21) 20.49,36.19 R2.1
$1N2063: length 2
  Bottom Layer w0.762: C8.1 19.12,36.05 R2.2
$1N2398: length 6.4
  Top Layer w0.762: R3.1 20.11,40.39 R4.2 R4.3
$1N2414: length 5.8
  Top Layer w0.762: R4.1 21.64,42.46 U2.5
$1N3333: length 1.6
  Top Layer w0.762: R7.2 22.92,12.06 U3.4
$1N3365: length 3
  Top Layer w0.762: v1(21.51,19.18) U3.6
  Bottom Layer w0.762: R8.1 21.51,17.92 v1(21.51,19.18)
$1N3368: length 4.1
  Bottom Layer w0.254: 26.35,11.94 26.35,13.96 26.22,14.1
  Bottom Layer w0.762: R8.2 19.62,17.52 C16.1
$1N3381: length 1.8
  Top Layer w0.762: R14.2 R13.1
$1N3386: length 4.8
  Top Layer w0.762: R14.1 26.07,17.16 R15.2 25.17,18.02 U3.5
$1N3390: length 1.8
  Top Layer w0.254: LED2.2 29.4,7.36 R12.1
$1N7071: length 5
  Bottom Layer w0.254: 6.74,44.58 7.39,43.93 7.39,41.27 Q2.3
$1N7072: length 4.8
  Bottom Layer w0.254: 1.74,44.58 1.74,40.2 R44.2
$1N7096: length 6.2
  Top Layer w0.762: SW4.1 95.42,24.89 v1(95.3,25.02)
  Bottom Layer w0.762: R33.1 93.48,24.27 R39.2 94.36,25.96 v1(95.3,25.02)
$1N7099: length 6.6
  Top Layer w0.762: SW3.1 95.42,30.86 v1(95.17,31.11)
  Bottom Layer w0.762: v1(95.17,31.11) 94.28,32 R38.2 R32.1
$1N7102: length 6.4
  Top Layer w0.762: SW5.1 95.17,36.83 v1(95.04,36.96)
  Bottom Layer w0.762: v1(95.04,36.96) 94.41,37.59 R37.2 R31.1
$1N7105: length 5.6
  Top Layer w0.762: v1(95.42,42.54) 97.22,42.54 SW1.1
  Bottom Layer w0.762: R30.1 R36.2 93.64,42.54 v1(95.42,42.54)
$1N7129: length 5
  Bottom Layer w0.762: R29.1 R35.2 96.95,11.18 SW6.2
$1N7130: length 4.5
  Bottom Layer w0.762: SW6.1 97.46,12.95 R34.2 R28.1
$1N7136: length 10.7
  Top Layer w0.762: C258.1 85.98,45.26 84.88,46.35 84.88,48.77 85.65,49.53 H30.7
$1N7140: length 12.1
  Top Layer w0.254: 40.43,2.92 40.43,3.49 45.07,8.13 49.71,8.13 R24.1
$1N7193: length 3.1
  Bottom Layer w0.254: H29.5 25.57,4.32 24.82,5.07 R20.2
$1N7194: length 2
  Bottom Layer w0.254: H29.1 31.3,4.56 R21.1
$1N7631: length 8.1
  Bottom Layer w0.254: R22.2 24.43,7.87 23.8,7.24 23.8,4.06 26.08,1.78 H29.6
$1N7670: length 7.3
  Bottom Layer w0.254: 31.04,8 30.65,8 30.27,7.62 30.27,3.05 H29.2
$1N7746: length 26.5
  Top Layer w0.254: v1(64.06,18.41) R25.1
  Bottom Layer w0.254: v1(64.06,18.41) 64.69,18.41 65.25,17.86 65.25,13.28 71.42,7.11 77.64,7.11 79.93,4.83 CN2.3
$1N7785: length 3.7
  Bottom Layer w0.254: R26.1 27.86,53.22 CN3.3
$1N7824: length 3.5
  Bottom Layer w0.254: CN4.3 39.93,52.59 R27.1
$1N8736: length 10
  Top Layer w0.762: 3.98,29.72 3.35,29.72 1.7,28.07 1.7,22.03 Q1.1
$1N8862:
  vias: v1(13.76,14.73) v1(14.14,13.59) v1(14.67,14.73) v1(15.03,13.59)
$1N16652: length 3.6
  Bottom Layer w0.762: 20.75,48.01 21.25,48.51 R43.2
$1N17060: length 19.9
  Bottom Layer w0.254: P16.16 33.45,27.56 35.35,29.46 45.79,29.46 46.66,28.6 46.66,25.91 47.8,24.76 48.4,24.76
$1N17066: length 17.9
  Bottom Layer w0.254: 48.4,26.03 47.93,26.03 47.04,26.92 47.04,28.83 45.89,29.97 33.96,29.97 P16.14
$1N17070: length 17.6
  Bottom Layer w0.254: P16.12 34.08,32 35.61,30.48 46.02,30.48 47.42,29.08 47.42,27.94 48.05,27.3 48.4,27.3
$1N17075: length 17.5
  Bottom Layer w0.254: P16.10 33.83,34.54 37.51,30.86 46.28,30.86 48.4,28.74 48.4,28.57
$1N17080: length 15.1
  Bottom Layer w0.254: P16.8 41.96,37.08 42.34,37.46 48.4,37.46
$1N17085: length 15.3
  Bottom Layer w0.254: 48.4,38.73 34.34,38.73 P16.6
$1N17090: length 15.9
  Bottom Layer w0.254: P16.4 34.59,42.16 36.8,39.95 48.34,39.95 48.4,40
$1N17095: length 16.9
  Bottom Layer w0.254: 48.4,41.27 47.55,41.27 46.85,40.58 37.57,40.58 P16.2
$1N17564: length 5.1
  Bottom Layer w0.762: 97.46,17.4 96.19,16.13 R48.1 R50.2
$1N17565: length 5
  Bottom Layer w0.762: SW10.1 96.19,21.21 R47.1 R49.2
$1N37902: length 2.7
  Top Layer w0.254: R51.1 90.72,5.09 CN9.3
$1N37946: length 9.1
  Top Layer w0.254: CN9.2 93.26,2.41 92.12,1.27 89.84,1.27 88.95,2.16 88.95,4.71 R52.1

## Copper pours and planes (outline as drawn; the poured copper is in the pictures)
GND on Top Layer: -29.54,80.01 141.65,80.01 141.65,-27.31 -29.54,-27.31
GND on Bottom Layer: -18.11,72.52 123.36,72.52 123.36,-12.83 -18.11,-12.83
GND on GND: 0.26,59.79 99.74,59.79 99.74,0.26 0.26,0.26
VCC on Top Layer: 0.65,17.87 10.08,17.87 10.08,8.51 0.65,8.51
VCC3V3 on Top Layer: 71.04,39.5 80.94,39.5 80.94,36.37 71.04,36.37
VCC3V3 on VCC: 46.53,44.58 99.74,44.58 99.74,0.26 46.53,0.26
VCC5V on Top Layer: 74.94,26.84 80.52,26.84 80.52,20.57 74.94,20.57
VCC5V on Top Layer: 26.87,12.85 29.26,12.85 29.26,8.31 26.87,8.31
VCC5V on Top Layer: 24.05,29.08 26.21,29.08 26.21,26.16 24.05,26.16
VCC5V on Top Layer: 79.42,49.78 83.58,49.78 83.58,46.76 79.42,46.76
VCC5V on Top Layer: 74.78,56.39 76.81,56.39 76.81,52.2 74.78,52.2
VCC5V on Top Layer: 70.91,36.32 77.28,36.32 77.28,29.97 70.91,29.97
VCC5V on Bottom Layer: 74.98,55.37 79.12,55.37 79.12,49.02 74.98,49.02
VCC5V on VCC: 16.18,59.79 99.74,59.79 99.74,0.26 16.18,0.26
VCCBAT on Top Layer: 5.64,22.37 15.03,22.37 15.03,15.43 5.64,15.43
VCCBAT on Top Layer: 11.5,33.02 20.75,33.02 20.75,20.45 11.5,20.45
VCCBAT on VCC: 0.26,59.79 15.41,59.79 15.41,0.26 0.26,0.26
VCCCAM on Top Layer: 69.77,29.24 77.77,29.24 77.77,27.18 69.77,27.18
VCCCAM on VCC: 29,47.5 72.69,47.5 72.69,20.34 29,20.34
VCCSERVO on Top Layer: 9.33,49.28 18.4,49.28 18.4,37.29 9.33,37.29
VCCTFT on Bottom Layer: 59.99,57.86 74.47,57.86 74.47,51.05 59.99,51.05
$1N1593 on Top Layer: 9.43,37.63 16.64,37.63 16.64,31.05 9.43,31.05
$1N3336 on Top Layer: 16.23,15.09 19.48,15.09 19.48,11.63 16.23,11.63
$1N3339 on Top Layer: 16.3,19.05 19.48,19.05 19.48,15.62 16.3,15.62
$1N3339 on Top Layer: 15.92,24.7 19.25,24.7 19.25,17.53 15.92,17.53
$1N8739 on Bottom Layer: 2.21,35.56 7.71,35.56 7.71,30.35 2.21,30.35
$1N8862 on Top Layer: 12.58,17.53 22.42,17.53 22.42,8.51 12.58,8.51
$1N8880 on Top Layer: 21.64,25.02 33.38,25.02 33.38,10.92 21.64,10.92

Small or netless copper shapes (teardrops, artwork), in the pictures only: 141 on Top Layer, 144 on Bottom Layer

## Text on the board
Top Silkscreen Layer: F2 | GND | VCC | C13 | E1 | E4 | NC | F4 | E0 | E2 | F1 | F5 | I9 | I8 | 3V3 | A2 | B9 | B8 | A1 | 5V | RTK | F0 | F15 | J10 | A13 | F14 | J11 | G | A11 | A12 | A10 | J0 | J1 | J2 | J3 | 5V G M0 M3 | F10 | J4 | J6 | F8 | + | - | 电调 | 双驱 | 陀螺仪 | 屏幕 | 编码器 | 接收机 | 串口 | 开 | 正 | 负
